# Altium project Pukk-Sensor-Module-v1.0.PrjPcb (part 5 of 6)
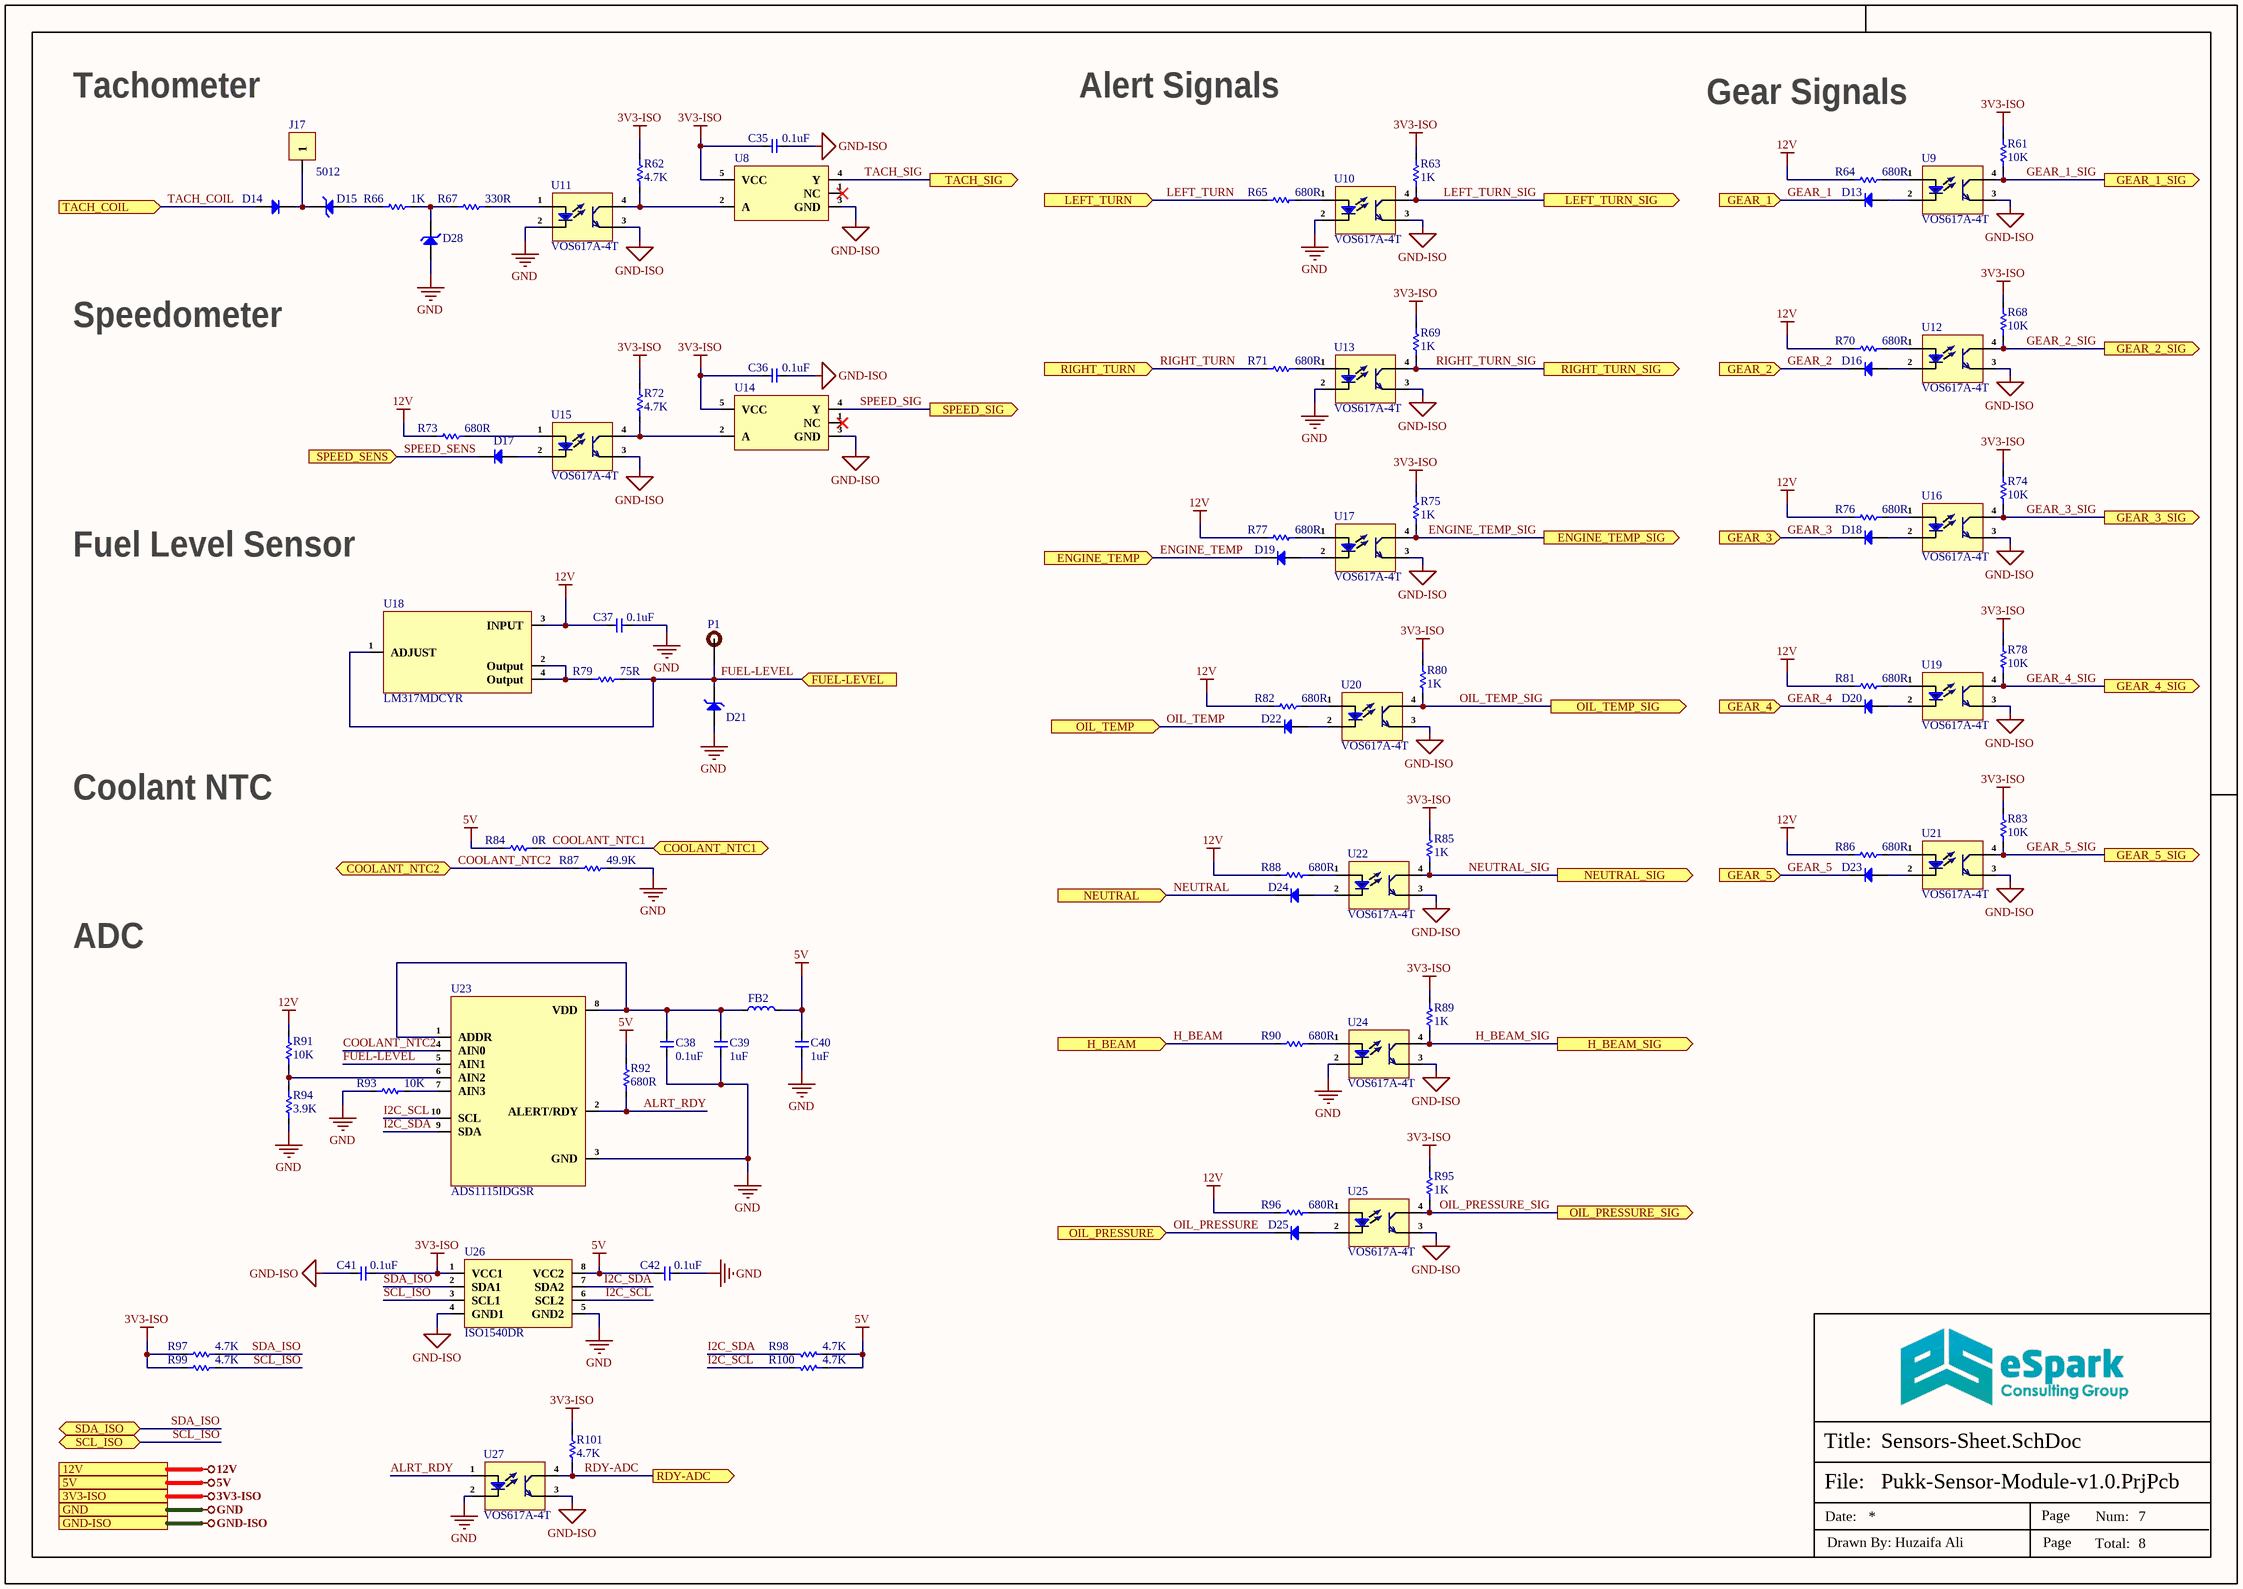
[diagram p8: Sensors-Sheet.SchDoc]

## Sheet Sensors-Sheet.SchDoc (continued)

### Library data of the parts
C35-C38 C41 C42 = CC0402KRX7R8BB104: CAP CER 0.1UF 25V X7R 0402; Manufacturer: Yageo; Tolerance: 10%; Capacitance: 100nF; Dissipation Factor: 3.5%; Supplier 1: Digi-Key; Manufacturer Part Number: CC0402KRX7R8BB104; RoHS: Yes; Category: Ceramic Capacitors; Stock 1: 1841009; Pricing 1: 1=0.10000, 10=0.03100, 50=0.01700, 100=0.01390, 500=0.00990, 1000=0.00777, 2500=0.00707, 5000=0.00650 (USD); Mount: Surface Mount; Case/Package: 0402; Case Code (Imperial): 0402; Case Code (Metric): 1005; Min Operating Temperature: -55°C; Max Operating Temperature: 125°C; Dielectric: X7R; Voltage Rating: 25V; Voltage Rating (DC): 25V; Packaging: Tape and Reel; Termination: SMD/SMT; Resistor Type: Ceramic; Length: 1mm; Width: 0.02inch; Height: 0.5mm; Thickness: 0.022inch; Depth: 0.5mm; Radiation Hardening: No; Lead Free: Lead Free; Halogen Free: Halogen Free; ComponentLink1URL: https://datasheet.ciiva.com/11464/upy-gphc-x7r-6-3v-to-50v-8-11464889.pdf?src-supplier=Avnet; ComponentLink1Description: https://datasheet.ciiva.com/11464/upy-gphc-x7r-6-3v-to-50v-8-11464889.pdf?src-supplier=Avnet; ComponentLink2URL: https://datasheet.ciiva.com/13210/upy-gphc-x7r-6-3v-to-50v-8-12304-13210908.pdf?src-supplier=Mouser; ComponentLink2Description: https://datasheet.ciiva.com/13210/upy-gphc-x7r-6-3v-to-50v-8-12304-13210908.pdf?src-supplier=Mouser; ComponentLink3URL: https://datasheet.ciiva.com/17437/upy-gphc-x7r-6-3v-to-50v-8-17437357.pdf?src-supplier=Avnet+Europe; ComponentLink3Description: https://datasheet.ciiva.com/17437/upy-gphc-x7r-6-3v-to-50v-8-17437357.pdf?src-supplier=Avnet+Europe; Supplier Part Number 1: 311-2077-1-ND; LCSC Part Number: C105883
C39 C40 = CC0402KRX5R8BB105: CAP CER 1UF 25V X5R 0402; Manufacturer: Yageo; Tolerance: 10%; Supplier 1: Mouser; Manufacturer Part Number: CC0402KRX5R8BB105; RoHS: Yes; Category: Ceramic Capacitors; Stock 1: 91975; Pricing 1: 1=0.30000, 10=0.20400, 50=0.20400, 100=0.11600, 1000=0.07200, 10000=0.05900 (USD); Mount: Surface Mount; Case/Package: 0402; Case Code (Metric): 1005; Case Code (Imperial): 0402; Weight: 2.3E-05oz; Min Operating Temperature: -55°C; Max Operating Temperature: 85°C; Packaging: Tape and Reel; Capacitance: 1uF; Voltage Rating: 25V; Dielectric: X5R; Termination: SMD/SMT; Voltage Rating (DC): 25V; Package Quantity: 10000; Length: 0.039inch; Width: 0.02inch; Thickness: 0.022inch; Lead Free: Lead Free; Halogen Free: Halogen Free; RoHS Compliant: Yes; ComponentLink1URL: http://www.mouser.com/ds/2/447/Yageo_UPY-GP_NP0_16V-to-50V_9-358835.pdf?src-supplier=Mouser; ComponentLink1Description: http://www.mouser.com/ds/2/447/Yageo_UPY-GP_NP0_16V-to-50V_9-358835.pdf?src-supplier=Mouser; ComponentLink2URL: http://www.yageo.com/documents/recent/UPY-GPHC_X5R_4V-to-50V_25.pdf?src-supplier=Digi-Key; ComponentLink2Description: http://www.yageo.com/documents/recent/UPY-GPHC_X5R_4V-to-50V_25.pdf?src-supplier=Digi-Key; ComponentLink3URL: https://4donline.ihs.com/images/VipMasterIC/IC/YAGO/YAGO-S-A0006851646/YAGO-S-A0006851646-1.pdf?hkey=6D3A4C79FDBF58556ACFDE234799DDF0&src-supplier=Newark; ComponentLink3Description: https://4donline.ihs.com/images/VipMasterIC/IC/YAGO/YAGO-S-A0006851646/YAGO-S-A0006851646-1.pdf?hkey=6D3A4C79FDBF58556ACFDE234799DDF0&src-supplier=Newark; Supplier Part Number 1: 603-CC402KRX5R8BB105; LCSC Part Number: C326568
D13 D16 D18-D20 D22-D25 = 1N4148W: 100V 400mW Single 1.25V@150mA 8ns 300mA SOD-123 Switching Diode ROHS; Manufacturer: JSMSEMI; ComponentLink1Description: LCSC; ComponentLink1URL: https://www.lcsc.com/product-detail/Switching-Diode_JSMSEMI-1N4148W_C917030.html; Manufacturer Part Number: 1N4148W; Package: SOD-123; LCSC Part Number: C917030; Item Type: Diode
D14 = ES1B: DIODE STANDARD 100V 1A DO214AC; Manufacturer: ON Semiconductor / Fairchild; Item Type: Diodes; Supplier: Arrow Electronics; LCSC Part Number: C232818; Manufacturer Part Number: ES1B; RoHS: Yes; Stock: 142500; Pricing: 7500=0.0732, 22500=0.0629 (USD); ComponentLink1URL: https://datasheet.ciiva.com/13095/es1b-187537-13095611.pdf?src-supplier=Mouser; ComponentLink1Description: https://datasheet.ciiva.com/13095/es1b-187537-13095611.pdf?src-supplier=Mouser; ComponentLink2URL: https://datasheet.ciiva.com/918/es1a-918414.pdf?src-supplier=Digikey; ComponentLink2Description: https://datasheet.ciiva.com/918/es1a-918414.pdf?src-supplier=Digikey; ComponentLink3URL: https://datasheet.ciiva.com/918/es1a-918415.pdf?src-supplier=Digikey; ComponentLink3Description: https://datasheet.ciiva.com/918/es1a-918415.pdf?src-supplier=Digikey; ComponentLink4URL: https://datasheet.ciiva.com/918/es1a-918416.pdf?src-supplier=Digikey; ComponentLink4Description: https://datasheet.ciiva.com/918/es1a-918416.pdf?src-supplier=Digikey; ComponentLink5URL: https://datasheet.ciiva.com/28468/575529-28468958.pdf?src-supplier=Element14; ComponentLink5Description: https://datasheet.ciiva.com/28468/575529-28468958.pdf?src-supplier=Element14; ComponentLink6URL: https://datasheet.ciiva.com/7965/575529-7965132.pdf?src-supplier=Element14; ComponentLink6Description: https://datasheet.ciiva.com/7965/575529-7965132.pdf?src-supplier=Element14
D15 = 1SMB5949BT3G: DIODE ZENER 100V 3W SMB; Manufacturer: ON Semiconductor; Item Type: Diodes; Supplier: Arrow Electronics; LCSC Part Number: C150045; Manufacturer Part Number: 1SMB5949BT3G; RoHS: Yes; Stock: 10000; Pricing: 2500=0.0809 (USD); ComponentLink1URL: https://datasheet.ciiva.com/15142/getdatasheetpartid-53879-15142134.pdf?src-supplier=Verical; ComponentLink1Description: https://datasheet.ciiva.com/15142/getdatasheetpartid-53879-15142134.pdf?src-supplier=Verical; ComponentLink2URL: https://datasheet.ciiva.com/18434/70099466-18434616.pdf?src-supplier=Allied+Electronics; ComponentLink2Description: https://datasheet.ciiva.com/18434/70099466-18434616.pdf?src-supplier=Allied+Electronics; ComponentLink3URL: https://datasheet.ciiva.com/895/1smb5913bt3-d-895236.pdf?src-supplier=Digikey; ComponentLink3Description: https://datasheet.ciiva.com/895/1smb5913bt3-d-895236.pdf?src-supplier=Digikey; ComponentLink4URL: https://datasheet.ciiva.com/895/1smb5913bt3-d-895237.pdf?src-supplier=Digikey; ComponentLink4Description: https://datasheet.ciiva.com/895/1smb5913bt3-d-895237.pdf?src-supplier=Digikey; ComponentLink5URL: https://datasheet.ciiva.com/895/1smb5913bt3-d-895238.pdf?src-supplier=Digikey; ComponentLink5Description: https://datasheet.ciiva.com/895/1smb5913bt3-d-895238.pdf?src-supplier=Digikey; ComponentLink6URL: https://datasheet.ciiva.com/8346/1smb5913bt3-d-8346409.pdf?src-supplier=Avnet; ComponentLink6Description: https://datasheet.ciiva.com/8346/1smb5913bt3-d-8346409.pdf?src-supplier=Avnet
D17 = 1N4148W-7-F: DIODE GEN PURP 100V 300MA SOD123; Manufacturer: Diodes; Forward Current: 150mA; Reverse Recovery Time: 4ns; Max Forward Surge Current (Ifsm): 2A; Element Configuration: Single; Max Reverse Current: 1uA; Forward Voltage: 1.25V; Power Dissipation: 400mW; Polarity: Standard; Voltage Rating (DC): 75V; Value: 2pF; Supplier 1: Future Electronics; Manufacturer Part Number: 1N4148W-7-F; RoHS: Yes; Category: Rectifier Diodes; Stock 1: 32931000; Pricing 1: 3000=0.01840, 12000=0.01760, 45000=0.01690, 120000=0.01640, 300000=0.01560 (USD); Mounting Technology: Surface Mount; Pins: 2; Weight: 0.000353oz; Contact Plating: Tin,Matte; Min Operating Temperature: -65°C; Max Operating Temperature: 150°C; Packaging: Tape and Reel; Max Repetitive Reverse Voltage (Vrrm): 100V; Peak Non-Repetitive Surge Current: 2A; Voltage: 100V; Max Surge Current: 2A; Package Quantity: 3000; Recovery Time: 4ns; Average Rectified Current: 300mA; Power Rating: 400mW; Current Rating: 150mA; Output Current: 150mA; Max Reverse Voltage (DC): 100V; Series: -; Reverse Recovery Time-Max: 4ns; Length: 2.85mm; Width: 1.7mm; Height: 1.25mm; Radiation Hardening: No; RoHS Compliant: Yes; Reach SVHC Compliant: Yes; Lead Free: Lead Free; ComponentLink1URL: https://datasheet.ciiva.com/1179/1915529-1179304.pdf?src-supplier=Element14; ComponentLink1Description: https://datasheet.ciiva.com/1179/1915529-1179304.pdf?src-supplier=Element14; ComponentLink2URL: https://datasheet.ciiva.com/22695/1915529-22695239.pdf?src-supplier=Element14; ComponentLink2Description: https://datasheet.ciiva.com/22695/1915529-22695239.pdf?src-supplier=Element14; ComponentLink3URL: https://datasheet.ciiva.com/8300/ds30086-8300392.pdf?src-supplier=Avnet; ComponentLink3Description: https://datasheet.ciiva.com/8300/ds30086-8300392.pdf?src-supplier=Avnet; ComponentLink4URL: https://datasheet.ciiva.com/15219/getdatasheetpartid-110030-15219548.pdf?src-supplier=Verical; ComponentLink4Description: https://datasheet.ciiva.com/15219/getdatasheetpartid-110030-15219548.pdf?src-supplier=Verical; ComponentLink5URL: https://datasheet.ciiva.com/8303/ds30086-8303197.pdf?src-supplier=Avnet; ComponentLink5Description: https://datasheet.ciiva.com/8303/ds30086-8303197.pdf?src-supplier=Avnet; ComponentLink6URL: https://datasheet.ciiva.com/911/ds30086-911735.pdf?src-supplier=Digi-Key; ComponentLink6Description: https://datasheet.ciiva.com/911/ds30086-911735.pdf?src-supplier=Digi-Key; ComponentLink7URL: https://datasheet.ciiva.com/911/ds30086-911736.pdf?src-supplier=Digi-Key; ComponentLink7Description: https://datasheet.ciiva.com/911/ds30086-911736.pdf?src-supplier=Digi-Key; ComponentLink8URL: https://datasheet.ciiva.com/911/ds30086-911734.pdf?src-supplier=Digi-Key; ComponentLink8Description: https://datasheet.ciiva.com/911/ds30086-911734.pdf?src-supplier=Digi-Key; ComponentLink9URL: https://datasheet.ciiva.com/4435/ds30086-4435128.pdf?src-supplier=Mouser; ComponentLink9Description: https://datasheet.ciiva.com/4435/ds30086-4435128.pdf?src-supplier=Mouser; Supplier Part Number 1: 7634694; LCSC Part Number: C83528; Item Type: Diode
D21 = MSP3V3HM3/89A: TVS DIODE 3.3VWM 11.5VC MICROSMP; Direction: Unidirectional; Operating Supply Voltage: 3.3V; Max Surge Current: 75A; Breakdown Voltage: 4.1V; Clamping Voltage: 11V; Peak Pulse Power: 150W; Number of Unidirectional Channels: 1; Power Line Protection: No; Peak Pulse Current: 87A; Test Current: 1mA; Max Reverse Leakage Current: 200uA; Diode Type: ZENER; LCSC Part Number: C241899; Item Type: TVS Diode; ComponentLink1Description: LCSC; Supplier: Mouser; Supplier Part Number: 625-MSP3V3HM3; RoHS: Yes; Category: TVS Diodes; Stock: 15021; Pricing: 1=0.39, 10=0.313, 50=0.313, 100=0.165, 1000=0.068, 10000=0.05 (USD); Mounting Technology: Surface Mount; Min Operating Temperature: -55°C; Max Operating Temperature: 150°C; Packaging: Tape and Reel; Package Quantity: 4500; Polarity: Unidirectional; Reverse Standoff Voltage: 3.3V; Min Breakdown Voltage: 4.1V; Series: Automotive, AEC-Q101, TransZorb®, eSMP™; RoHS Compliant: Yes; ComponentLink2URL: https://datasheet.ciiva.com/14080/msp3v3-14080471.pdf?src-supplier=Digi-Key; ComponentLink2Description: https://datasheet.ciiva.com/14080/msp3v3-14080471.pdf?src-supplier=Digi-Key
D28 = 1SMA4755A: Independent Type 40.9V~45.6V 1W 43V SMA Zener Diodes ROHS; Manufacturer: Shandong Jingdao Microelectronics; Item Type: Diode; Manufacturer Part Number: 1SMA4755A; Package: SMA; LCSC Part Number: C438373; ComponentLink1Description: LCSC; ComponentLink1URL: https://www.lcsc.com/product-detail/Zener-Diodes_Shandong-Jingdao-Microelectronics-1SMA4755A_C438373.html
FB2 = MMZ2012R102ATD25: FERRITE BEAD 1K OHM 0805 1LN; Manufacturer: TDK; Number of Lines: 1; Max Current Rating: 500mA; DC Resistance (DCR): 300mR; Impedance: 1kR; Tolerance: 25%; Test Frequency: 100MHz; Supplier 1: Digi-Key; Manufacturer Part Number: MMZ2012R102ATD25; RoHS: Yes; Category: Ferrite Beads and Chips; Stock 1: 2942; Pricing 1: 1=0.11000, 10=0.09200, 25=0.08280, 50=0.06080, 100=0.05240, 250=0.04140, 500=0.03496, 1000=0.02944 (USD); Mount: Surface Mount; Case/Package: 0805; Case Code (Metric): 2012; Case Code (Imperial): 0805; Weight: 0.000194oz; Min Operating Temperature: -55°C; Max Operating Temperature: 125°C; Package Quantity: 4000; Packaging: Tape and Reel; Termination: SMD/SMT; Max DC Current: 500mA; Length: 0.079inch; Width: 0.049inch; Height: 0.041inch; Ratings: AEC-Q200; RoHS Compliant: Yes; ComponentLink1URL: http://www.mouser.com/ds/2/400/beads_automotive_signal_mmz_en-469244.pdf?src-supplier=Mouser; ComponentLink1Description: http://www.mouser.com/ds/2/400/beads_automotive_signal_mmz_en-469244.pdf?src-supplier=Mouser; ComponentLink2URL: https://product.tdk.com/info/en/catalog/datasheets/beads_automotive_signal_mmz2012_en.pdf?src-supplier=Digi-Key; ComponentLink2Description: https://product.tdk.com/info/en/catalog/datasheets/beads_automotive_signal_mmz2012_en.pdf?src-supplier=Digi-Key; Supplier Part Number 1: 445-MMZ2012R102ATD25CT-ND; LCSC Part Number: C307765; Item Type: Ferrite Bead
J17 = 5012: PC TEST POINT MULTIPURPOSE WHITE; Manufacturer: Keystone Electronics; Item Type: Connectors; Supplier: Digikey; LCSC Part Number: C2906766; Manufacturer Part Number: 5012; RoHS: Yes; Stock: 102631; Pricing: 1=0.38, 25=0.308, 100=0.3015, 250=0.28304, 500=0.2523, 1000=0.17746, 2500=0.16225, 5000=0.15211 (USD); ComponentLink1URL: https://datasheet.ciiva.com/27052/1582065-27052612.pdf?src-supplier=Jameco; ComponentLink1Description: https://datasheet.ciiva.com/27052/1582065-27052612.pdf?src-supplier=Jameco; ComponentLink2URL: https://datasheet.ciiva.com/16200/m60-2p60-16200039.pdf?src-supplier=Future+Electronics; ComponentLink2Description: https://datasheet.ciiva.com/16200/m60-2p60-16200039.pdf?src-supplier=Future+Electronics; ComponentLink3URL: https://datasheet.ciiva.com/22631/1703983-22631115.pdf?src-supplier=Element14; ComponentLink3Description: https://datasheet.ciiva.com/22631/1703983-22631115.pdf?src-supplier=Element14; ComponentLink4URL: https://datasheet.ciiva.com/16884/70182825-16884150.pdf?src-supplier=Allied+Electronics; ComponentLink4Description: https://datasheet.ciiva.com/16884/70182825-16884150.pdf?src-supplier=Allied+Electronics; ComponentLink5URL: https://datasheet.ciiva.com/2917/5012-2917634.pdf?src-supplier=Digikey; ComponentLink5Description: https://datasheet.ciiva.com/2917/5012-2917634.pdf?src-supplier=Digikey; ComponentLink6URL: https://datasheet.ciiva.com/1454/1703983-1454835.pdf?src-supplier=Element14; ComponentLink6Description: https://datasheet.ciiva.com/1454/1703983-1454835.pdf?src-supplier=Element14
P1 = TEST POINT 0.5mm Dia: Test Point ON; Item Type: Test Point; Manufacturer Part Number: TEST POINT 0.5mm Dia
R61 R68 R74 R78 R83 = RC0402FR-0710KL: RES 10K OHM 1% 1/16W 0402; Manufacturer: Yageo; Resistance: 10kR; Voltage Rating (DC): 50V; Temperature Coefficient: 100ppm/°C; Power Rating: 62.5mW; Max Power Dissipation: 63mW; Item Type: Resistor; Supplier 1: Mouser; Manufacturer Part Number: RC0402FR-0710KL; RoHS: Yes; Category: Chip SMD Resistors; Stock 1: 18648329; Pricing 1: 1=0.10000, 10=0.01400, 50=0.01400, 100=0.00500, 1000=0.00300, 10000=0.00200 (USD); Case/Package: 0402; Number of Pins: 2; Case Code (Imperial): 0402; Case Code (Metric): 1005; Min Operating Temperature: -55°C; Max Operating Temperature: 155°C; Resistor Type: Thick Film; Tolerance: 1%; Packaging: Tape and Reel; Voltage Rating: 50V; Termination: SMD/SMT; Working Voltage: 50V; Number of Terminations: 2; Features: Moisture Resistant; Series: RC; Resistance Tolerance: 1%; Construction: Rectangular; Length: 1mm; Width: 0.5mm; Height: 0.32mm; Depth: 0.5mm; Lead Pitch: 0.2mm; REACH SVHC: No SVHC; Lead Free: Lead Free; RoHS Compliant: Yes; Military Standard: Not; ComponentLink1URL: https://datasheet.ciiva.com/7660/38568-7660787.pdf?src-supplier=Element14; ComponentLink1Description: https://datasheet.ciiva.com/7660/38568-7660787.pdf?src-supplier=Element14; ComponentLink2URL: https://datasheet.ciiva.com/7849/1686128-7849814.pdf?src-supplier=Element14; ComponentLink2Description: https://datasheet.ciiva.com/7849/1686128-7849814.pdf?src-supplier=Element14; ComponentLink3URL: https://datasheet.ciiva.com/7983/1018594-7983486.pdf?src-supplier=Element14; ComponentLink3Description: https://datasheet.ciiva.com/7983/1018594-7983486.pdf?src-supplier=Element14; ComponentLink4URL: https://datasheet.ciiva.com/22747/1018594-22747512.pdf?src-supplier=Element14; ComponentLink4Description: https://datasheet.ciiva.com/22747/1018594-22747512.pdf?src-supplier=Element14; ComponentLink5URL: https://datasheet.ciiva.com/12667/pyu-rc0402-51-rohs-l-6-r-12667067.pdf?src-supplier=Mouser; ComponentLink5Description: https://datasheet.ciiva.com/12667/pyu-rc0402-51-rohs-l-6-r-12667067.pdf?src-supplier=Mouser; ComponentLink6URL: https://datasheet.ciiva.com/7849/1784430-7849813.pdf?src-supplier=Element14; ComponentLink6Description: https://datasheet.ciiva.com/7849/1784430-7849813.pdf?src-supplier=Element14; ComponentLink7URL: https://datasheet.ciiva.com/7849/1784430-7849815.pdf?src-supplier=Element14; ComponentLink7Description: https://datasheet.ciiva.com/7849/1784430-7849815.pdf?src-supplier=Element14; Supplier Part Number 1: 603-RC0402FR-0710KL; LCSC Part Number: C60490
R62 R72 R97-R101 = RC0402FR-074K7L: RES 4.7K OHM 1% 1/16W 0402; Manufacturer: Yageo; Voltage Rating (DC): 50V; Power Rating: 62.5mW; Resistance: 4.7kR; Temperature Coefficient: 100ppm/°C; Max Power Dissipation: 63mW; Item Type: Resistor; Supplier 1: Avnet; Manufacturer Part Number: RC0402FR-074K7L; RoHS: Yes; Category: Chip SMD Resistors; Stock 1: 2420000; Pricing 1: 10000=0.00085 (USD); Case/Package: 0402; Number of Pins: 2; Case Code (Imperial): 0402; Case Code (Metric): 1005; Size Code: 0402; Min Operating Temperature: -55°C; Max Operating Temperature: 155°C; Tolerance: 1%; Voltage Rating: 50V; Packaging: Tape and Reel; Resistor Type: Thick Film; Termination: SMD/SMT; Features: Moisture Resistant; Series: RC; Number of Terminations: 2; Resistance Tolerance: 1%; Construction: Rectangular; Length: 1mm; Width: 0.5mm; Height: 0.32mm; Depth: 0.5mm; Height - Seated (Max): 0.016inch; RoHS Compliant: Yes; Reach SVHC Compliant: Yes; Military Standard: Not; Lead Free: Lead Free; ComponentLink1URL: https://datasheet.ciiva.com/22661/1686128-22661342.pdf?src-supplier=Element14; ComponentLink1Description: https://datasheet.ciiva.com/22661/1686128-22661342.pdf?src-supplier=Element14; ComponentLink2URL: https://datasheet.ciiva.com/7850/1018594-7850022.pdf?src-supplier=Element14; ComponentLink2Description: https://datasheet.ciiva.com/7850/1018594-7850022.pdf?src-supplier=Element14; ComponentLink3URL: https://datasheet.ciiva.com/7850/1018594-7850023.pdf?src-supplier=Element14; ComponentLink3Description: https://datasheet.ciiva.com/7850/1018594-7850023.pdf?src-supplier=Element14; ComponentLink4URL: https://datasheet.ciiva.com/15215/getdatasheetpartid-328119-15215035.pdf?src-supplier=Verical; ComponentLink4Description: https://datasheet.ciiva.com/15215/getdatasheetpartid-328119-15215035.pdf?src-supplier=Verical; Supplier Part Number 1: RC0402FR-074K7L; LCSC Part Number: C105871
R63 R69 R75 R80 R85 R89 R95 = RC0402FR-071KL: RES 1K OHM 1% 1/16W 0402; Manufacturer: Yageo; Resistance: 1kR; Temperature Coefficient: 100ppm/°C; Voltage Rating (DC): 50V; Power Rating: 62.5mW; Max Power Dissipation: 63mW; Item Type: Resistor; Supplier 1: Avnet; Manufacturer Part Number: RC0402FR-071KL; RoHS: Yes; Category: Chip SMD Resistors; Stock 1: 13030000; Pricing 1: 10000=0.00085, 20000=0.00087, 40000=0.00084, 60000=0.00083, 80000=0.00079, 100000=0.00078, 1000000=0.00076 (USD); Case/Package: 0402; Number of Pins: 2; Case Code (Imperial): 0402; Case Code (Metric): 1005; Size Code: 0402; Min Operating Temperature: -55°C; Max Operating Temperature: 155°C; Resistor Type: Thick Film; Tolerance: 1%; Packaging: Tape and Reel; Voltage Rating: 50V; Termination: SMD/SMT; Features: Moisture Resistant; Series: RC; Number of Terminations: 2; Resistance Tolerance: 1%; Construction: Rectangular; Technology: THICK FILM; Length: 1mm; Width: 0.5mm; Height: 0.32mm; Depth: 0.5mm; Reach SVHC Compliant: Yes; Lead Free: Lead Free; RoHS Compliant: Yes; Military Standard: Not; ComponentLink1URL: https://datasheet.ciiva.com/11819/0900766b80c66297-11819477.pdf?src-supplier=RSComponents; ComponentLink1Description: https://datasheet.ciiva.com/11819/0900766b80c66297-11819477.pdf?src-supplier=RSComponents; ComponentLink2URL: https://datasheet.ciiva.com/7983/1018594-7983502.pdf?src-supplier=Element14; ComponentLink2Description: https://datasheet.ciiva.com/7983/1018594-7983502.pdf?src-supplier=Element14; ComponentLink3URL: https://datasheet.ciiva.com/22747/1018594-22747513.pdf?src-supplier=Element14; ComponentLink3Description: https://datasheet.ciiva.com/22747/1018594-22747513.pdf?src-supplier=Element14; ComponentLink4URL: https://datasheet.ciiva.com/12666/pyu-rc0402-51-rohs-l-6-r-12666741.pdf?src-supplier=Mouser; ComponentLink4Description: https://datasheet.ciiva.com/12666/pyu-rc0402-51-rohs-l-6-r-12666741.pdf?src-supplier=Mouser; ComponentLink5URL: https://datasheet.ciiva.com/7849/1018594-7849869.pdf?src-supplier=Element14; ComponentLink5Description: https://datasheet.ciiva.com/7849/1018594-7849869.pdf?src-supplier=Element14; ComponentLink6URL: https://datasheet.ciiva.com/7849/1018594-7849871.pdf?src-supplier=Element14; ComponentLink6Description: https://datasheet.ciiva.com/7849/1018594-7849871.pdf?src-supplier=Element14; ComponentLink7URL: https://datasheet.ciiva.com/17063/pyu-rc0402-51-rohs-l-6-r-17063193.pdf?src-supplier=Future+Electronics; ComponentLink7Description: https://datasheet.ciiva.com/17063/pyu-rc0402-51-rohs-l-6-r-17063193.pdf?src-supplier=Future+Electronics; Supplier Part Number 1: RC0402FR-071KL; LCSC Part Number: C106235
R64 R65 R70 R71 R73 R76 R77 R81 R82 R86 R88 R90 R92 R96 = RC0402FR-07680RL: RES 680 OHM 1% 1/16W 0402; Manufacturer: Yageo; Temperature Coefficient: 100ppm/°C; Power Rating: 63mW; Voltage Rating: 50V; Item Type: Resistor; Supplier 1: Future Electronics; Manufacturer Part Number: RC0402FR-07680RL; RoHS: Yes; Category: Chip SMD Resistors; Stock 1: 5080000; Pricing 1: 10000=0.0011, 100000=0.0011, 300000=0.001, 750000=0.001, 2000000=0.0009 (USD); Case/Package: 0402; Case Code (Imperial): 0402; Case Code (Metric): 1005; Size Code: 0402; Min Operating Temperature: -55°C; Max Operating Temperature: 155°C; Resistance: 680R; Tolerance: 1%; Packaging: Tape and Reel; Resistor Type: Thick Film; Termination: SMD/SMT; Features: Moisture Resistant; Series: RC; Max Power Dissipation: 63mW; Number of Terminations: 2; Resistance Tolerance: 1%; Construction: Rectangular; Voltage Rating (AC): 50V; Length: 1mm; Depth: 0.5mm; Reach SVHC Compliant: No; Lead Free: Lead Free; Military Standard: Not; RoHS Compliant: Yes; ComponentLink1URL: https://datasheet.ciiva.com/12667/pyu-rc0402-51-rohs-l-6-r-12667916.pdf?src-supplier=Mouser; ComponentLink1Description: https://datasheet.ciiva.com/12667/pyu-rc0402-51-rohs-l-6-r-12667916.pdf?src-supplier=Mouser; ComponentLink2URL: https://datasheet.ciiva.com/7850/1018594-7850071.pdf?src-supplier=Element14; ComponentLink2Description: https://datasheet.ciiva.com/7850/1018594-7850071.pdf?src-supplier=Element14; ComponentLink3URL: https://datasheet.ciiva.com/7850/1018594-7850070.pdf?src-supplier=Element14; ComponentLink3Description: https://datasheet.ciiva.com/7850/1018594-7850070.pdf?src-supplier=Element14; ComponentLink4URL: https://datasheet.ciiva.com/17042/pyu-rc0402-51-rohs-l-6-r-17042399.pdf?src-supplier=Future+Electronics; ComponentLink4Description: https://datasheet.ciiva.com/17042/pyu-rc0402-51-rohs-l-6-r-17042399.pdf?src-supplier=Future+Electronics; Supplier Part Number 1: 7948052
R66 = RC1206FR-071KL: RES 1K OHM 1% 1/4W 1206; Manufacturer: Yageo; Item Type: Resistors; Value: 1kR; Power Rating: 250mW; Voltage Rating: 200V; Temperature Coefficient: 100ppm/°C; Supplier: Future Electronics; LCSC Part Number: C131398; Manufacturer Part Number: RC1206FR-071KL; RoHS: Yes; Stock: 1675000; Pricing: 5000=0.003, 20000=0.0029, 75000=0.0028, 125000=0.0033, 150000=0.0027, 250000=0.0032, 375000=0.0026 (USD); Case/Package: 1206; Case Code (Imperial): 1206; Case Code (Metric): 3216; Min Operating Temperature: -55°C; Max Operating Temperature: 155°C; Tolerance: 1%; Packaging: Tape and Reel; Resistor Type: Thick Film; Termination: SMD/SMT; Series: RC; Resistance Tolerance: 1%; Technology: THICK FILM; Voltage Rating (AC): 200V; Length: 3.1mm; Height: 0.55mm; Depth: 1.6mm; Lead Free: Lead Free; RoHS Compliant: Yes; Reach SVHC Compliant: Unknown; ComponentLink1URL: https://datasheet.ciiva.com/11808/0900766b80c6630a-11808217.pdf?src-supplier=Rs; ComponentLink1Description: https://datasheet.ciiva.com/11808/0900766b80c6630a-11808217.pdf?src-supplier=Rs; ComponentLink2URL: https://datasheet.ciiva.com/29181/402540-da-01-en-smd-widerstand-chip1206-1-kohm-29181462.pdf?src-supplier=Conrad; ComponentLink2Description: https://datasheet.ciiva.com/29181/402540-da-01-en-smd-widerstand-chip1206-1-kohm-29181462.pdf?src-supplier=Conrad; ComponentLink3URL: https://datasheet.ciiva.com/46445/444357-46445708.pdf?src-supplier=Element14; ComponentLink3Description: https://datasheet.ciiva.com/46445/444357-46445708.pdf?src-supplier=Element14
R67 = RC1206FR-07330RL: RES 330 OHM 1% 1/4W 1206; Manufacturer: Yageo; Item Type: Resistors; Voltage Rating (AC): 200V; Supplier: Future Electronics; LCSC Part Number: C114944; Manufacturer Part Number: RC1206FR-07330RL; RoHS: Yes; Stock: 365000; Pricing: 5000=0.0038, 20000=0.0037, 75000=0.0035, 125000=0.0035, 250000=0.0033 (USD); Lead Free: 5697LeadFree; ComponentLink1URL: https://datasheet.ciiva.com/11819/0900766b80c6630a-11819921.pdf?src-supplier=Rs; ComponentLink1Description: https://datasheet.ciiva.com/11819/0900766b80c6630a-11819921.pdf?src-supplier=Rs; ComponentLink2URL: https://datasheet.ciiva.com/17422/pyu-rc1206-51-rohs-l-4-17422588.pdf?src-supplier=Future+Electronics; ComponentLink2Description: https://datasheet.ciiva.com/17422/pyu-rc1206-51-rohs-l-4-17422588.pdf?src-supplier=Future+Electronics
R79 = RC0603FR-0775RL: RES 75 OHM 1% 1/10W 0603; Manufacturer: Yageo; Temperature Coefficient: 100ppm/°C; Voltage Rating (DC): 50V; Power Rating: 100mW; Item Type: Resistor; Supplier: Digikey; Supplier Part Number: 311-75.0HRCT-ND; Manufacturer Part Number: RC0603FR-0775RL; RoHS: Yes; Category: Chip SMD Resistors; Stock: 844005; Pricing: 1=0.1, 10=0.019, 50=0.0112, 100=0.0093, 500=0.00622, 1000=0.00532 (USD); Case/Package: 0603; Case Code (Metric): 1608; Case Code (Imperial): 0603; Min Operating Temperature: -55°C; Max Operating Temperature: 155°C; Value: 75R; Tolerance: 1%; Resistor Type: Thick Film; Packaging: Tape and Reel; Voltage Rating: 50V; Package Quantity: 1; Number of Terminations: 2; Termination: SMD/SMT; Max Power Dissipation: 100mW; Features: Moisture Resistant; Series: RC; Resistance Tolerance: 1%; Construction: Rectangular; Technology: THICK FILM; Length: 0.063inch; Width: 0.031inch; Height: 0.022inch; Depth: 0.8mm; Lead Free: 5697LeadFree; Reach SVHC Compliant: No; Military Standard: Not; RoHS Compliant: Yes; LCSC Part Number: C112309
R84 = RC0402FR-070RL: RES 0 OHM JUMPER 1/16W 0402; Manufacturer: Yageo; Tolerance: 1%; Power Rating: 62.5mW; Voltage Rating: 50V; Temperature Coefficient: 200ppm/°C; Max Power Dissipation: 63mW; Supplier 1: Mouser; Manufacturer Part Number: RC0402FR-070RL; RoHS: Yes; Category: Chip SMD Resistors; Stock 1: 8556842; Pricing 1: 1=0.10000, 10=0.01400, 50=0.01400, 100=0.00600, 1000=0.00300, 5000=0.00200, 10000=0.00100 (USD); Mount: Surface Mount; Case/Package: 0402; Contact Plating: Tin,Matte; Case Code (Imperial): 0402; Case Code (Metric): 1005; Size Code: 0402; Min Operating Temperature: -55°C; Max Operating Temperature: 155°C; Resistance: 0R; Resistor Type: Thick Film; Packaging: Tape and Reel; Termination: SMD/SMT; Features: Moisture Resistant; Series: RC; Number of Terminations: 2; Length: 1mm; Width: 0.5mm; Height: 0.35mm; Radiation Hardening: No; Lead Free: Lead Free; RoHS Compliant: Yes; ComponentLink1URL: https://datasheet.ciiva.com/8896/pyu-rc0402-51-rohs-l-6-8896149.pdf?src-supplier=Avnet; ComponentLink1Description: https://datasheet.ciiva.com/8896/pyu-rc0402-51-rohs-l-6-8896149.pdf?src-supplier=Avnet; ComponentLink2URL: https://datasheet.ciiva.com/16790/pyu-rc0402-51-rohs-l-6-r-16790444.pdf?src-supplier=Future+Electronics; ComponentLink2Description: https://datasheet.ciiva.com/16790/pyu-rc0402-51-rohs-l-6-r-16790444.pdf?src-supplier=Future+Electronics; Supplier Part Number 1: 603-RC0402FR-070RL; LCSC Part Number: C106231
R87 = RC0402FR-0749K9L: RES 49.9K OHM 1% 1/16W 0402; Manufacturer: Yageo; Power Rating: 62.5mW; Value: 49.9kR; Voltage Rating: 50V; Temperature Coefficient: 100ppm/°C; Max Power Dissipation: 63mW; Item Type: Resistor; Supplier: Digikey; Supplier Part Number: 311-49.9KLRCT-ND; Manufacturer Part Number: RC0402FR-0749K9L; RoHS: Yes; Category: Chip SMD Resistors; Stock: 5084418; Pricing: 1=0.1, 10=0.015, 50=0.0088, 100=0.0073, 500=0.00488, 1000=0.00417, 5000=0.00297 (USD); Case/Package: 0402; Case Code (Imperial): 0402; Case Code (Metric): 1005; Min Operating Temperature: -55°C; Max Operating Temperature: 155°C; Tolerance: 1%; Packaging: Tape and Reel; Termination: SMD/SMT; Voltage Rating (DC): 50V; Features: Moisture Resistant; Series: RC; Number of Terminations: 2; Construction: Rectangular; Length: 1mm; Depth: 0.5mm; RoHS Compliant: Yes; Military Standard: Not; Lead Free: Lead Free; ComponentLink1URL: https://datasheet.ciiva.com/17071/pyu-rc0402-51-rohs-l-6-r-17071066.pdf?src-supplier=Future+Electronics; ComponentLink1Description: https://datasheet.ciiva.com/17071/pyu-rc0402-51-rohs-l-6-r-17071066.pdf?src-supplier=Future+Electronics; LCSC Part Number: C137969
R91 R93 = RT0603BRD0710KL: RES SMD 10K OHM 0.1% 1/10W 0603; Manufacturer: Yageo; Power: 100mW; Rated Temperature: 70°C; Value: 10kR; Temperature Coefficient: 25ppm/°C; Working Voltage: 75V; Package Height: 0.45mm; Package Length: 1.6mm; Package Width: 0.8mm; Item Type: Resistor; Supplier 1: Rs; Manufacturer Part Number: RT0603BRD0710KL; RoHS: Yes; Category: Chip SMD Resistors; Stock 1: 20510; Pricing 1: 100=0.29800, 250=0.27800, 500=0.25900, 1000=0.23700 (GBP); Mounting Technology: Surface Mount; Pins: 2; Case/Package: 0603; Min Operating Temperature: -55°C; Max Operating Temperature: 155°C; Tolerance: 0.1%; Resistor Type: FIXED RESISTOR; Construction: Chip; Package Style: SMTMeter; Packaging: Tape and Reel; Technology: THIN FILM; Termination: Wraparound; Reach SVHC Compliant: Yes; RoHS Compliant: Yes; ComponentLink1URL: https://datasheet.ciiva.com:443/pdfs/VipMasterIC/IC/YAGO/YAGO-S-A0008510989/YAGO-S-A0008510989-1.pdf?src-supplier=IHS+Markit; ComponentLink1Description: https://datasheet.ciiva.com:443/pdfs/VipMasterIC/IC/YAGO/YAGO-S-A0008510989/YAGO-S-A0008510989-1.pdf?src-supplier=IHS+Markit; ComponentLink2URL: https://datasheet.ciiva.com/5624/pyu-rt-1-to-0-05-rohs-l-4-5624351.pdf?src-supplier=Mouser; ComponentLink2Description: https://datasheet.ciiva.com/5624/pyu-rt-1-to-0-05-rohs-l-4-5624351.pdf?src-supplier=Mouser; ComponentLink3URL: https://datasheet.ciiva.com/29721/pyu-rt-1-to-0-05-rohs-l-4-29721177.pdf?src-supplier=Digi-Key; ComponentLink3Description: https://datasheet.ciiva.com/29721/pyu-rt-1-to-0-05-rohs-l-4-29721177.pdf?src-supplier=Digi-Key; Supplier Part Number 1: 1991391P; LCSC Part Number: C95204
R94 = RC0402FR-073K9L: RES 3.9K OHM 1% 1/16W 0402; Manufacturer: Yageo; Temperature Coefficient: 100ppm/°C; Power Rating: 62.5mW; Value: 3.9kR; Voltage Rating: 50V; Max Power Dissipation: 63mW; Item Type: Resistor; Supplier: Future Electronics; Supplier Part Number: 9808155; Manufacturer Part Number: RC0402FR-073K9L; RoHS: Yes; Category: Chip SMD Resistors; Stock: 6910000; Pricing: 10000=0.0011, 100000=0.0011, 300000=0.001, 750000=0.001, 2000000=0.0009 (USD); Case/Package: 0402; Case Code (Imperial): 0402; Case Code (Metric): 1005; Min Operating Temperature: -55°C; Max Operating Temperature: 155°C; Tolerance: 1%; Packaging: Tape and Reel; Resistor Type: Thick Film; Series: RC; Termination: SMD/SMT; Number of Terminations: 2; Features: Moisture Resistant; Resistance Tolerance: 1%; Construction: Rectangular; Voltage Rating (AC): 50V; Length: 1mm; Depth: 0.5mm; Lead Free: Lead Free; RoHS Compliant: Yes; Reach SVHC Compliant: Unknown; Military Standard: Not; ComponentLink1URL: https://datasheet.ciiva.com/12666/pyu-rc0402-51-rohs-l-6-r-12666997.pdf?src-supplier=Mouser; ComponentLink1Description: https://datasheet.ciiva.com/12666/pyu-rc0402-51-rohs-l-6-r-12666997.pdf?src-supplier=Mouser; ComponentLink2URL: https://datasheet.ciiva.com/7849/1018594-7849989.pdf?src-supplier=Element14; ComponentLink2Description: https://datasheet.ciiva.com/7849/1018594-7849989.pdf?src-supplier=Element14; ComponentLink3URL: https://datasheet.ciiva.com/7849/1018594-7849990.pdf?src-supplier=Element14; ComponentLink3Description: https://datasheet.ciiva.com/7849/1018594-7849990.pdf?src-supplier=Element14; ComponentLink4URL: https://datasheet.ciiva.com/15189/getdatasheetpartid-469246-15189453.pdf?src-supplier=Verical; ComponentLink4Description: https://datasheet.ciiva.com/15189/getdatasheetpartid-469246-15189453.pdf?src-supplier=Verical; LCSC Part Number: C131467
U8 U14 = SN74AHC1G14DBVR: IC INVERTER 1CH 1-INP SOT23-5; Manufacturer: Texas Instruments; Number of Elements: 1; Max Supply Voltage: 5.5V; Min Supply Voltage: 2V; Propagation Delay: 10.6ns; Logic Function: Inverter,Schmitt Trigger; Low Level Output Current: 8mA; Quiescent Current: 1uA; High Level Output Current: -8mA; Turn-On Delay Time: 18.5ns; Input Type: SCHMITT TRIGGER; Supplier: Mouser; LCSC Part Number: C7469; Manufacturer Part Number: SN74AHC1G14DBVR; RoHS: Yes; Item Type: IC; Stock: 69702; Pricing: 1=0.1, 10=0.062, 50=0.054, 100=0.046, 1000=0.037, 10000=0.031 (USD); Mounting Technology: Surface Mount; Case/Package: SOT-23; Pins: 5; Weight: 0.000557oz; Min Operating Temperature: -40°C; Max Operating Temperature: 125°C; Packaging: Tape and Reel; Number of Inputs: 1; Number of Gates: 1; Number of Circuits: 1; Number of Bits: 1; Series: 74AHC; Technology: CMOS; Max Output current: 8mA; Output Current: 8mA; Termination: SMD/SMT; Radiation Hardening: No; Lead Free: Lead Free; RoHS Compliant: Yes; Reach SVHC Compliant: No; ComponentLink1URL: https://datasheet.ciiva.com/4219/814sn74ahc1g14-4219764.pdf?src-supplier=Arrow+Electronics; ComponentLink1Description: https://datasheet.ciiva.com/4219/814sn74ahc1g14-4219764.pdf?src-supplier=Arrow+Electronics; ComponentLink2URL: https://datasheet.ciiva.com/15089/getdatasheetpartid-190002-15089353.pdf?src-supplier=Verical; ComponentLink2Description: https://datasheet.ciiva.com/15089/getdatasheetpartid-190002-15089353.pdf?src-supplier=Verical; ComponentLink3URL: https://datasheet.ciiva.com/7783/sn74ahc1g14-7783206.pdf?src-supplier=Element14; ComponentLink3Description: https://datasheet.ciiva.com/7783/sn74ahc1g14-7783206.pdf?src-supplier=Element14; ComponentLink4URL: https://datasheet.ciiva.com/7783/sn74ahc1g14-7783205.pdf?src-supplier=Element14; ComponentLink4Description: https://datasheet.ciiva.com/7783/sn74ahc1g14-7783205.pdf?src-supplier=Element14; ComponentLink5URL: https://datasheet.ciiva.com/46384/1882896-46384391.pdf?src-supplier=Element14; ComponentLink5Description: https://datasheet.ciiva.com/46384/1882896-46384391.pdf?src-supplier=Element14; ComponentLink6URL: https://datasheet.ciiva.com/1864/sn74ahc1g14-1864204.pdf?src-supplier=Digikey; ComponentLink6Description: https://datasheet.ciiva.com/1864/sn74ahc1g14-1864204.pdf?src-supplier=Digikey; ComponentLink7URL: https://datasheet.ciiva.com/1864/sn74ahc1g14-1864203.pdf?src-supplier=Digikey; ComponentLink7Description: https://datasheet.ciiva.com/1864/sn74ahc1g14-1864203.pdf?src-supplier=Digikey; ComponentLink8URL: https://datasheet.ciiva.com/1864/sn74ahc1g14-1864205.pdf?src-supplier=Digikey; ComponentLink8Description: https://datasheet.ciiva.com/1864/sn74ahc1g14-1864205.pdf?src-supplier=Digikey; ComponentLink9URL: https://datasheet.ciiva.com/48703/001074495-da-01-en-ic-schmitt-sn74ahc1g14dbvr-sot-23-5-tid-48703787.pdf?src-supplier=Conrad; ComponentLink9Description: https://datasheet.ciiva.com/48703/001074495-da-01-en-ic-schmitt-sn74ahc1g14dbvr-sot-23-5-tid-48703787.pdf?src-supplier=Conrad
U9-U13 U15-U17 U19-U22 U24 U25 U27 = VOS617A-4T: OPTOISO 3.75KV 1CH TRANS 4-SSOP; Manufacturer: Vishay Semiconductors; Item Type: Optocouplers; Supplier: Arrow Electronics; LCSC Part Number: C4749236; Manufacturer Part Number: VOS617A-4T; RoHS: Yes; Stock: 6000; Pricing: 3000=0.1642, 6000=0.1638, 9000=0.1528, 15000=0.1513, 21000=0.1495, 30000=0.1428 (USD); ComponentLink1URL: https://datasheet.ciiva.com/14809/vos617a-14809107.pdf?src-supplier=Arrow+Electronics; ComponentLink1Description: https://datasheet.ciiva.com/14809/vos617a-14809107.pdf?src-supplier=Arrow+Electronics; ComponentLink2URL: https://datasheet.ciiva.com/30032/vos617a-30032543.pdf?src-supplier=Avnet; ComponentLink2Description: https://datasheet.ciiva.com/30032/vos617a-30032543.pdf?src-supplier=Avnet; ComponentLink3URL: https://datasheet.ciiva.com/18615/vos617a-18615995.pdf?src-supplier=Digikey; ComponentLink3Description: https://datasheet.ciiva.com/18615/vos617a-18615995.pdf?src-supplier=Digikey
U18 = LM317MDCYR: IC REG LIN POS ADJ 500MA SOT223; Manufacturer: Texas Instruments; Output Voltage: 37V; Number of Outputs: 1; Min Input Voltage: 4.2V; Max Supply Voltage: 40V; Polarity: Positive; Min Output Voltage: 1.25V; Quiescent Current: 3.5mA; Output Type: Adjustable; Reference Voltage: 1.3V; Power Supply Rejection Ratio (PSRR): 80dB; Supplier: Mouser; Supplier Part Number: 595-LM317MDCYR; Manufacturer Part Number: LM317MDCYR; RoHS: Yes; Category: Voltage Regulators - Linear; Stock: 12890; Pricing: 1=0.67, 10=0.564, 50=0.564, 100=0.428, 500=0.359, 1000=0.283, 2500=0.263, 5000=0.245, 10000=0.236, 25000=0.227 (USD); Mounting Technology: Surface Mount; Case/Package: SOT-223-4; Pins: 4; Weight: 0.006632oz; Min Operating Temperature: -40°C; Max Operating Temperature: 125°C; Packaging: Tape and Reel; Output Current: 500mA; Number of Regulators: 1; Max Output Voltage: 37V; Package Quantity: 1; Max Output current: 500mA; Series: -; Radiation Hardening: No; Reach SVHC Compliant: No; Lead Free: Lead Free; RoHS Compliant: Yes; ComponentLink1URL: https://datasheet.ciiva.com/1643/755612-1643356.pdf?src-supplier=Newark; ComponentLink1Description: https://datasheet.ciiva.com/1643/755612-1643356.pdf?src-supplier=Newark; ComponentLink2URL: https://datasheet.ciiva.com/41458/001014040-da-01-en-ic-reg-adj-0-5-lm317mdcyr-sot-223-4-tid-41458215.pdf?src-supplier=Conrad; ComponentLink2Description: https://datasheet.ciiva.com/41458/001014040-da-01-en-ic-reg-adj-0-5-lm317mdcyr-sot-223-4-tid-41458215.pdf?src-supplier=Conrad; ComponentLink3URL: https://datasheet.ciiva.com/1512/1814942-1512040.pdf?src-supplier=Element14; ComponentLink3Description: https://datasheet.ciiva.com/1512/1814942-1512040.pdf?src-supplier=Element14; ComponentLink4URL: https://datasheet.ciiva.com/46398/755612-46398903.pdf?src-supplier=Element14; ComponentLink4Description: https://datasheet.ciiva.com/46398/755612-46398903.pdf?src-supplier=Element14; ComponentLink5URL: https://datasheet.ciiva.com/46419/1814942-46419370.pdf?src-supplier=Element14; ComponentLink5Description: https://datasheet.ciiva.com/46419/1814942-46419370.pdf?src-supplier=Element14; ComponentLink6URL: https://datasheet.ciiva.com/2042/lm317m-2042100.pdf?src-supplier=Digikey; ComponentLink6Description: https://datasheet.ciiva.com/2042/lm317m-2042100.pdf?src-supplier=Digikey; ComponentLink7URL: https://datasheet.ciiva.com/2042/lm317m-2042099.pdf?src-supplier=Digikey; ComponentLink7Description: https://datasheet.ciiva.com/2042/lm317m-2042099.pdf?src-supplier=Digikey; ComponentLink8URL: https://datasheet.ciiva.com/2042/lm317m-2042101.pdf?src-supplier=Digikey; ComponentLink8Description: https://datasheet.ciiva.com/2042/lm317m-2042101.pdf?src-supplier=Digikey; ComponentLink9URL: https://datasheet.ciiva.com/14280/lm317mq-14280776.pdf?src-supplier=Avnet; ComponentLink9Description: https://datasheet.ciiva.com/14280/lm317mq-14280776.pdf?src-supplier=Avnet; LCSC Part Number: C840113; Item Type: IC
U23 = ADS1115IDGSR: IC ADC 16BIT SIGMA-DELTA 10VSSOP; Manufacturer: Texas Instruments; Interface: I2C; Number of Bits: 16; Sampling Rate: 860S/s; Number of A/D Converters: 1; Resolution: 16b; Polarity: Bipolar; Min Supply Voltage: 2V; Max Supply Voltage: 5.5V; Supply Type: Single; Conversion Rate: 0.86KS/s; Number of Inputs: 4; Integral Nonlinearity (INL): 1LSB; Power Dissipation: 900uW; Nominal Supply Current: 150uA; Number of Channels: 2; Supplier: Mouser; Supplier Part Number: 595-ADS1115IDGSR; Manufacturer Part Number: ADS1115IDGSR; RoHS: Yes; Category: Analog to Digital Converters (ADCs); Stock: 5925; Pricing: 1=5.44, 10=4.76, 50=4.76, 100=4.01, 1000=2.88, 10000=2.78 (USD); Case/Package: VSSOP; Pins: 10; Contact Plating: Gold; Min Operating Temperature: -40°C; Max Operating Temperature: 125°C; Package Quantity: 2500; Packaging: Tape and Reel; Number of Converters: 1; Max Supply Voltage (DC): 5.5V; Min Supply Voltage (DC): 2V; Series: -; Length: 3mm; Width: 3mm; Height: 1.07mm; Thickness: 1.02mm; Reach SVHC Compliant: No; Lead Free: Lead Free; RoHS Compliant: Yes; ComponentLink1URL: https://datasheet.ciiva.com/4031/47725463s8438921n7713-4031028.pdf?src-supplier=Arrow+Electronics; ComponentLink1Description: https://datasheet.ciiva.com/4031/47725463s8438921n7713-4031028.pdf?src-supplier=Arrow+Electronics; LCSC Part Number: C37593; Item Type: IC
U26 = ISO1540DR: DGTL ISOLTR 2.5KV 2CH I2C 8-SOIC; Manufacturer: Texas Instruments; Item Type: IC; Number of Channels: 2; Data Rate: 1Mbps; Min Supply Voltage: 3V; Max Supply Voltage: 5.5V; Channel Type: Bidirectional; Propagation Delay: 70ns; Isolated Power: No; Pulse Width Distortion (PWD): 21ns; Working Voltage: 566V; Supply Current: 3.6mA; Interface: 39,4268Interface; Supplier: Mouser; LCSC Part Number: C179739; Manufacturer Part Number: ISO1540DR; RoHS: Yes; Stock: 9421; Pricing: 1=4.01, 10=2.79, 50=2.79, 100=2.52, 1000=2.25, 10000=2.16 (USD); Case/Package: SOIC; Pins: 8; Min Operating Temperature: -40°C; Max Operating Temperature: 125°C; Packaging: Tape and Reel; Package Quantity: 1; Series: -; Length: 4.9mm; Width: 3.91mm; Height: 1.75mm; Thickness: 1.58mm; Reach SVHC Compliant: No; Lead Free: Lead Free; RoHS Compliant: Yes; ComponentLink1URL: https://datasheet.ciiva.com/6579/iso1540-6579724.pdf?src-supplier=Digikey; ComponentLink1Description: https://datasheet.ciiva.com/6579/iso1540-6579724.pdf?src-supplier=Digikey; ComponentLink2URL: https://datasheet.ciiva.com/6579/iso1540-6579723.pdf?src-supplier=Digikey; ComponentLink2Description: https://datasheet.ciiva.com/6579/iso1540-6579723.pdf?src-supplier=Digikey; ComponentLink3URL: https://datasheet.ciiva.com/6579/iso1540-6579725.pdf?src-supplier=Digikey; ComponentLink3Description: https://datasheet.ciiva.com/6579/iso1540-6579725.pdf?src-supplier=Digikey; ComponentLink4URL: https://datasheet.ciiva.com/14196/iso1540-14196749.pdf?src-supplier=Avnet; ComponentLink4Description: https://datasheet.ciiva.com/14196/iso1540-14196749.pdf?src-supplier=Avnet

## Sheet Connector-Sheet.SchDoc
size 420 x 297 mm; SheetNumber: 8; SheetTotal: 8
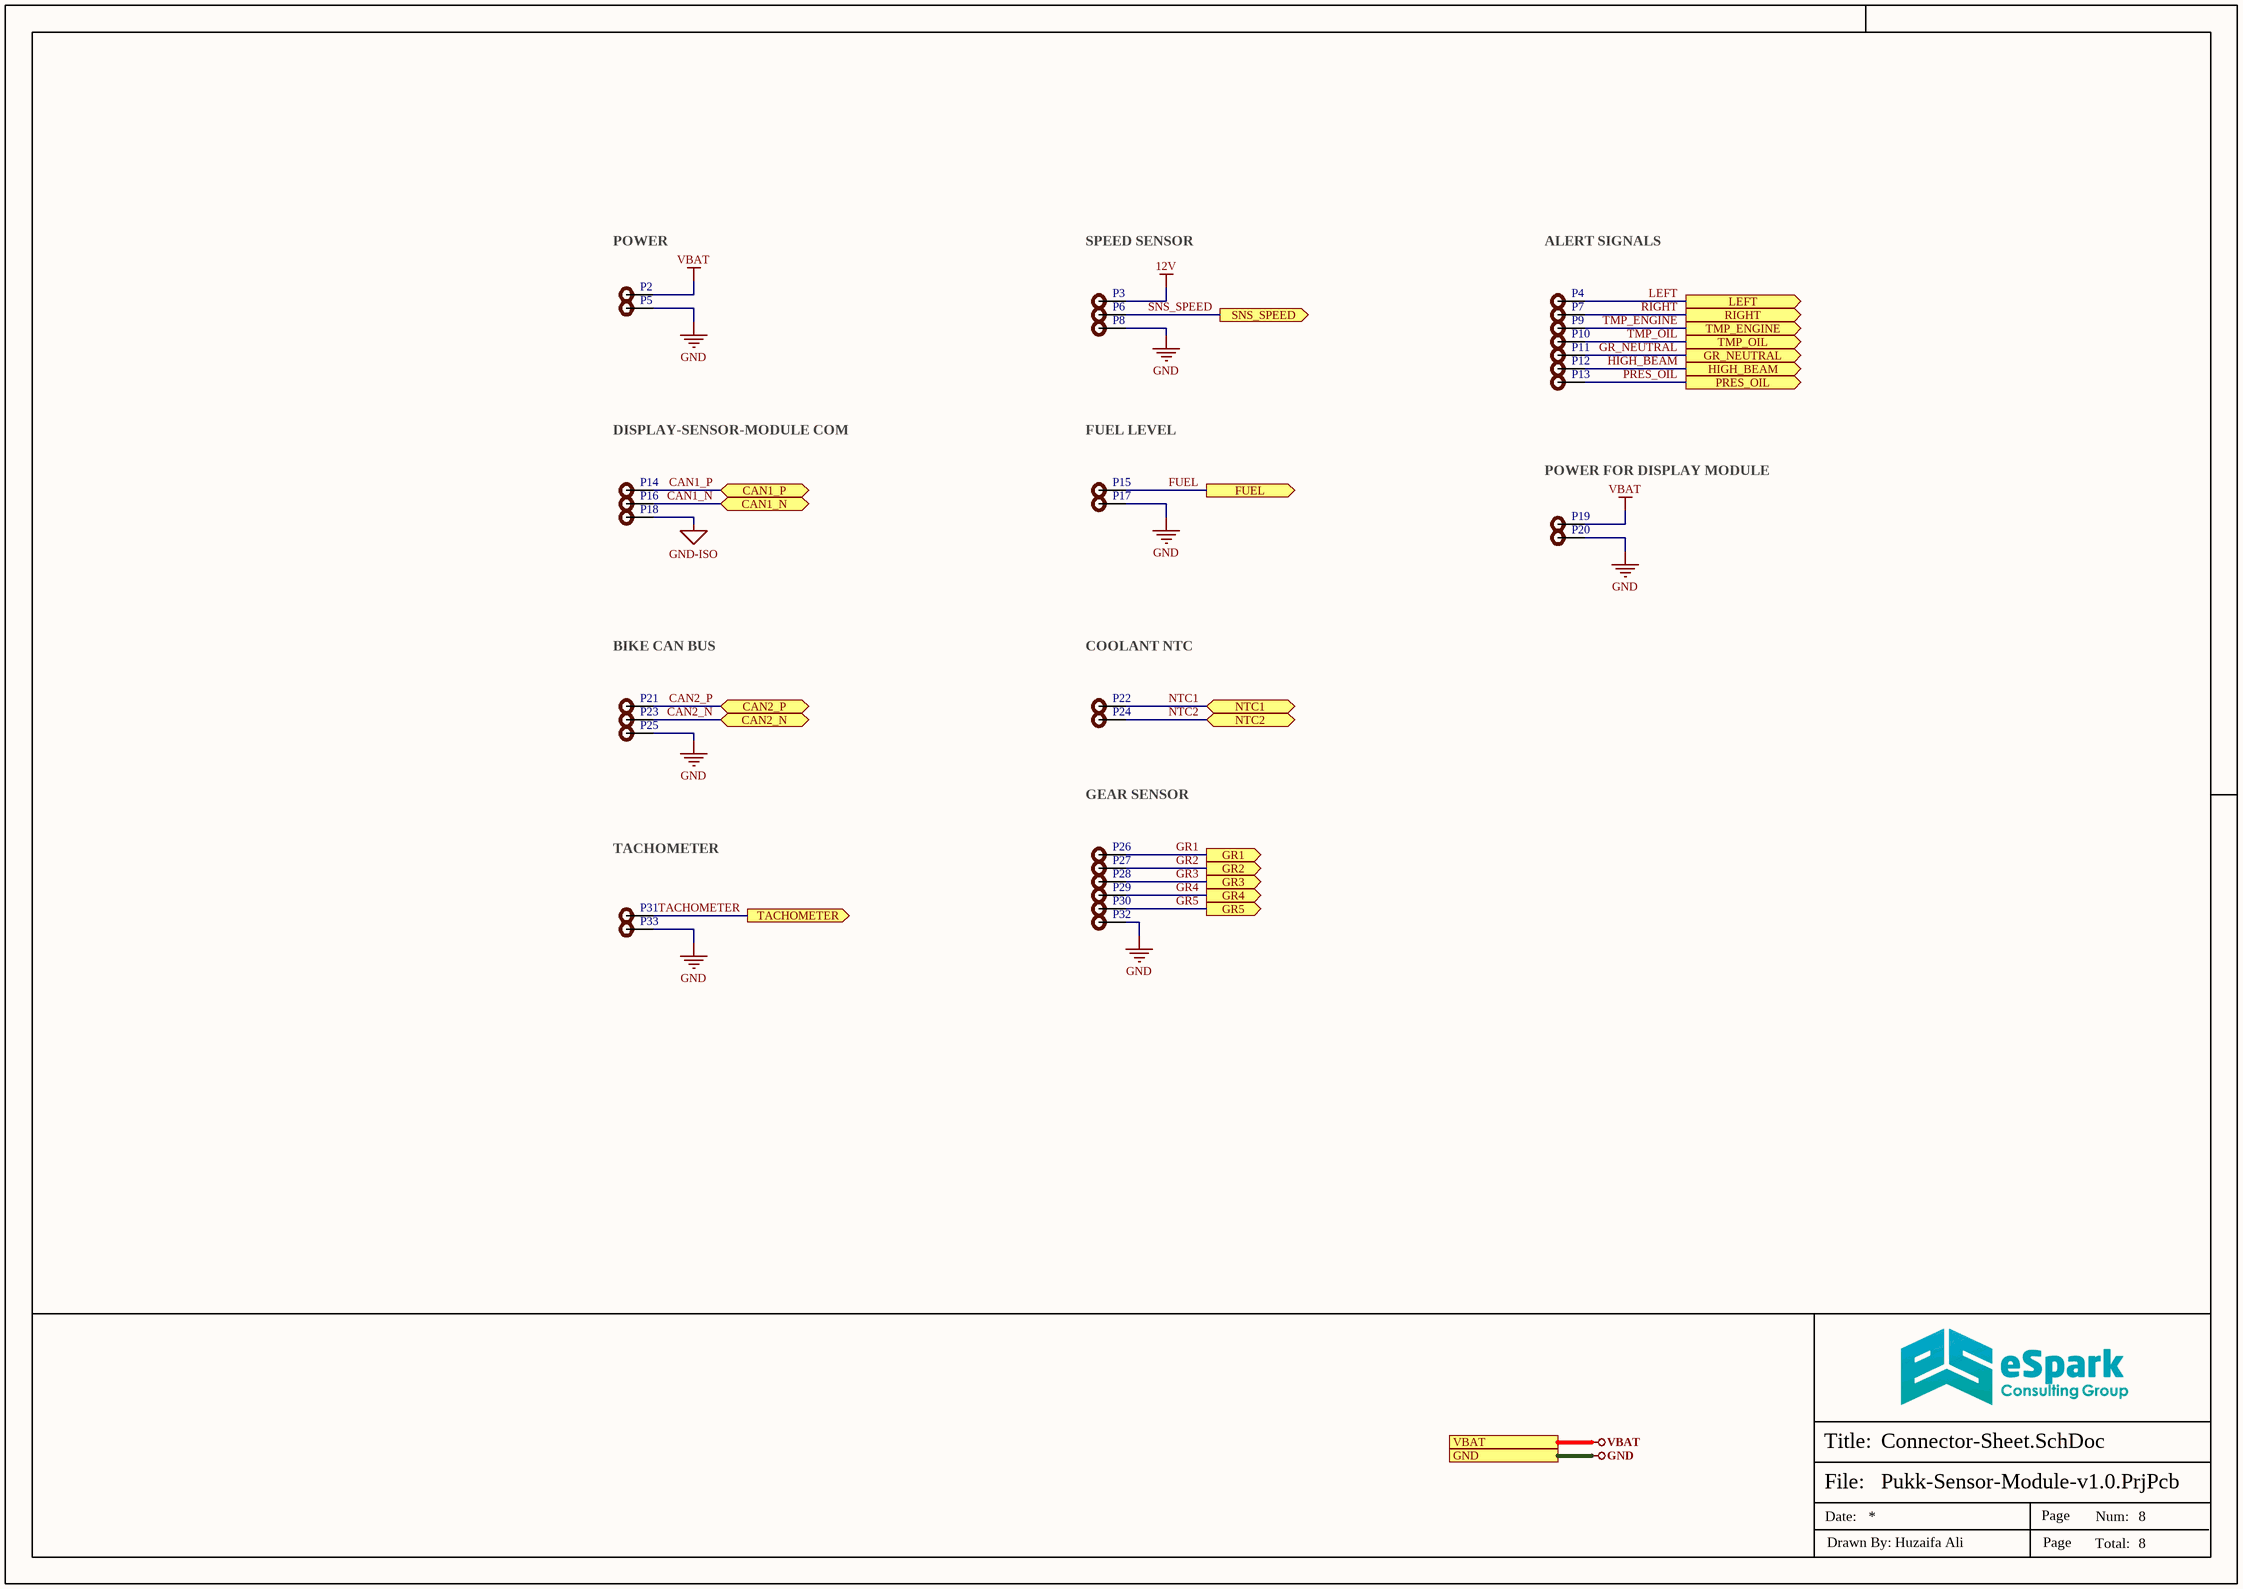
[diagram p7: Connector-Sheet.SchDoc]

### Parts
P2  0.5mm Test Pad  [0.5mm Test Pad]  (value not drawn)  (no BOM)
P3  0.5mm Test Pad  [0.5mm Test Pad]  (value not drawn)  (no BOM)
P4  0.5mm Test Pad  [0.5mm Test Pad]  (value not drawn)  (no BOM)
P5  0.5mm Test Pad  [0.5mm Test Pad]  (value not drawn)  (no BOM)
P6  0.5mm Test Pad  [0.5mm Test Pad]  (value not drawn)  (no BOM)
P7  0.5mm Test Pad  [0.5mm Test Pad]  (value not drawn)  (no BOM)
P8  0.5mm Test Pad  [0.5mm Test Pad]  (value not drawn)  (no BOM)
P9  0.5mm Test Pad  [0.5mm Test Pad]  (value not drawn)  (no BOM)
P10  0.5mm Test Pad  [0.5mm Test Pad]  (value not drawn)  (no BOM)
P11  0.5mm Test Pad  [0.5mm Test Pad]  (value not drawn)  (no BOM)
P12  0.5mm Test Pad  [0.5mm Test Pad]  (value not drawn)  (no BOM)
P13  0.5mm Test Pad  [0.5mm Test Pad]  (value not drawn)  (no BOM)
P14  0.5mm Test Pad  [0.5mm Test Pad]  (value not drawn)  (no BOM)
P15  0.5mm Test Pad  [0.5mm Test Pad]  (value not drawn)  (no BOM)
P16  0.5mm Test Pad  [0.5mm Test Pad]  (value not drawn)  (no BOM)
P17  0.5mm Test Pad  [0.5mm Test Pad]  (value not drawn)  (no BOM)
P18  0.5mm Test Pad  [0.5mm Test Pad]  (value not drawn)  (no BOM)
P19  0.5mm Test Pad  [0.5mm Test Pad]  (value not drawn)  (no BOM)
P20  0.5mm Test Pad  [0.5mm Test Pad]  (value not drawn)  (no BOM)
P21  0.5mm Test Pad  [0.5mm Test Pad]  (value not drawn)  (no BOM)
P22  0.5mm Test Pad  [0.5mm Test Pad]  (value not drawn)  (no BOM)
P23  0.5mm Test Pad  [0.5mm Test Pad]  (value not drawn)  (no BOM)
P24  0.5mm Test Pad  [0.5mm Test Pad]  (value not drawn)  (no BOM)
P25  0.5mm Test Pad  [0.5mm Test Pad]  (value not drawn)  (no BOM)
P26  0.5mm Test Pad  [0.5mm Test Pad]  (value not drawn)  (no BOM)
P27  0.5mm Test Pad  [0.5mm Test Pad]  (value not drawn)  (no BOM)
P28  0.5mm Test Pad  [0.5mm Test Pad]  (value not drawn)  (no BOM)
P29  0.5mm Test Pad  [0.5mm Test Pad]  (value not drawn)  (no BOM)
P30  0.5mm Test Pad  [0.5mm Test Pad]  (value not drawn)  (no BOM)
P31  0.5mm Test Pad  [0.5mm Test Pad]  (value not drawn)  (no BOM)
P32  0.5mm Test Pad  [0.5mm Test Pad]  (value not drawn)  (no BOM)
P33  0.5mm Test Pad  [0.5mm Test Pad]  (value not drawn)  (no BOM)

### Ports
CAN1_N (bidir, see Top-Sheet[5B], CAN-Sheet[5B]), CAN1_P (bidir, see Top-Sheet[5B], CAN-Sheet[5A]), CAN2_N (bidir, see Top-Sheet[5B], CAN-Sheet[5C]), CAN2_P (bidir, see Top-Sheet[5B], CAN-Sheet[5C]), FUEL (out, see Top-Sheet[5C]), GND (see Top-Sheet[5B], Power-Sheet[4D], Sensors-Sheet[1D]), GR1 (out, see Top-Sheet[5C]), GR2 (out, see Top-Sheet[5C]), GR3 (out, see Top-Sheet[5C]), GR4 (out, see Top-Sheet[5C]), GR5 (out, see Top-Sheet[5C]), GR_NEUTRAL (out, see Top-Sheet[5C]), HIGH_BEAM (out, see Top-Sheet[5C]), LEFT (out, see Top-Sheet[5C]), NTC1 (bidir, see Top-Sheet[5C]), NTC2 (bidir, see Top-Sheet[5C]), PRES_OIL (out, see Top-Sheet[5C]), RIGHT (out, see Top-Sheet[5C]), SNS_SPEED (out, see Top-Sheet[5C]), TACHOMETER (out, see Top-Sheet[5C]), TMP_ENGINE (out, see Top-Sheet[5C]), TMP_OIL (out, see Top-Sheet[5C]), VBAT (see Top-Sheet[5B], Power-Sheet[4D])

### Nets
12V: P3.1
GND: P5.1 P8.1 P17.1 P20.1 P25.1 P32.1 P33.1 ; port GND
GND-ISO: P18.1
VBAT: P2.1 P19.1 ; port VBAT
CAN1_N: P16.1 ; port CAN1_N
CAN1_P: P14.1 ; port CAN1_P
CAN2_N: P23.1 ; port CAN2_N
CAN2_P: P21.1 ; port CAN2_P
FUEL: P15.1 ; port FUEL
GR1: P26.1 ; port GR1  [project net GEAR_1]
GR2: P27.1 ; port GR2  [project net GEAR_2]
GR3: P28.1 ; port GR3  [project net GEAR_3]
GR4: P29.1 ; port GR4  [project net GEAR_4]
GR5: P30.1 ; port GR5  [project net GEAR_5]
GR_NEUTRAL: P11.1 ; port GR_NEUTRAL
HIGH_BEAM: P12.1 ; port HIGH_BEAM  [project net H_BEAM]
LEFT: P4.1 ; port LEFT
NTC1: P22.1 ; port NTC1  [project net COOLANT_NTC1]
NTC2: P24.1 ; port NTC2  [project net COOLANT_NTC2]
PRES_OIL: P13.1 ; port PRES_OIL  [project net OIL_PRESSURE]
RIGHT: P7.1 ; port RIGHT
SNS_SPEED: P6.1 ; port SNS_SPEED
TACHOMETER: P31.1 ; port TACHOMETER  [project net TACH_COIL]
TMP_ENGINE: P9.1 ; port TMP_ENGINE  [project net ENGINE_TEMP]
TMP_OIL: P10.1 ; port TMP_OIL  [project net OIL_TEMP]

### Notes on the sheet
- POWER
- SPEED SENSOR
- ALERT SIGNALS
- DISPLAY-SENSOR-MODULE COM
- FUEL LEVEL
- POWER FOR DISPLAY MODULE
- BIKE CAN BUS
- COOLANT NTC
- GEAR SENSOR
- TACHOMETER
- File:
- Title:
- Date:
- Page
- Num:
- Total:
- Drawn By: Huzaifa Ali

### Library data of the parts
P2-P33 = 0.5mm Test Pad: Test pad